# Altium project CubliV2.PrjPcb
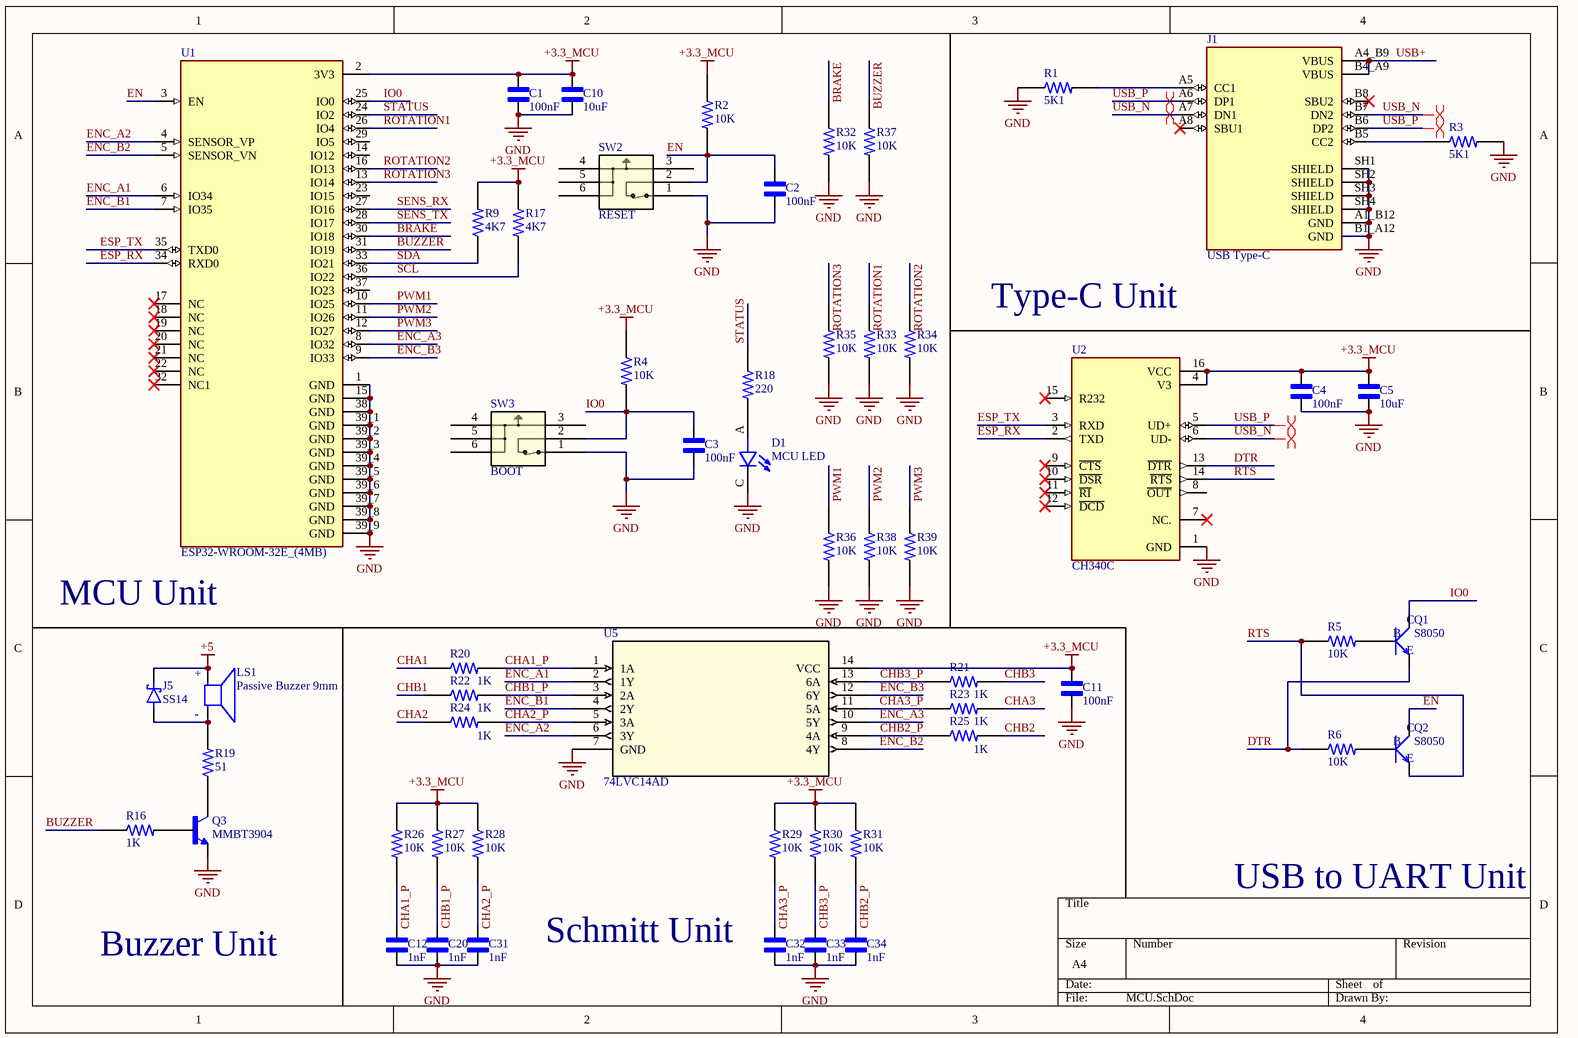
[diagram p0: MCU.SchDoc]
3 sheets, 107 parts. Net scope: global (net labels, ports and power ports of the same name join across sheets).
Board file: CubliV2PCB.PcbDoc
Sheets:
  MCU.SchDoc
  Power.SchDoc
  Connector.SchDoc

## Sheet MCU.SchDoc
size A4; SheetNumber: 1; SheetTotal: 3

### Parts
C1  100nF  [CAPC1608X90N]
C2  100nF  [CAPC1608X90N]
C3  100nF  [CAPC1608X90N]
C4  100nF  [CAPC1608X90N]
C5  10uF  [CAPC1608X90N]
C10  10uF  [CAPC1608X90N]
C11  100nF  [CAPC1608X90N]
C12  1nF  [CAPC1608X90N]
C20  1nF  [CAPC1608X90N]
C31  1nF  [CAPC1608X90N]
C32  1nF  [CAPC1608X90N]
C33  1nF  [CAPC1608X90N]
C34  1nF  [CAPC1608X90N]
D1  MCU LED  [LEDSC125X200X90-2N]
J1  USB Type-C  [AMPHENOL_10155435-00011LF]
J5  SS14  [SMA]
LS1  Passive Buzzer 9mm  [XDCR_AT-0927-TT-2-R]
Q1  S8050  [SOT-23]
Q2  S8050  [SOT-23]
Q3  MMBT3904  [TRANS_MMBT3904]
R1  5K1  [RESC1607X60N]
R2  10K  [RESC1607X60N]
R3  5K1  [RESC1607X60N]
R4  10K  [RESC1607X60N]
R5  10K  [RESC1607X60N]
R6  10K  [RESC1607X60N]
R9  4K7  [RESC1607X60N]
R16  1K  [RESC1607X60N]
R17  4K7  [RESC1607X60N]
R18  220  [RESC1607X60N]
R19  51  [RESC1607X60N]
R20  1K  [RESC1607X60N]
R21  1K  [RESC1607X60N]
R22  1K  [RESC1607X60N]
R23  1K  [RESC1607X60N]
R24  1K  [RESC1607X60N]
R25  1K  [RESC1607X60N]
R26  10K  [RESC1607X60N]
R27  10K  [RESC1607X60N]
R28  10K  [RESC1607X60N]
R29  10K  [RESC1607X60N]
R30  10K  [RESC1607X60N]
R31  10K  [RESC1607X60N]
R32  10K  [RESC1607X60N]
R33  10K  [RESC1607X60N]
R34  10K  [RESC1607X60N]
R35  10K  [RESC1607X60N]
R36  10K  [RESC1607X60N]
R37  10K  [RESC1607X60N]
R38  10K  [RESC1607X60N]
R39  10K  [RESC1607X60N]
SW2  RESET  [PTS820 J25K SMTR LFS_CNK]
SW3  BOOT  [PTS820 J25K SMTR LFS_CNK]
U1  ESP32-WROOM-32E_(4MB)  [XCVR_ESP32-WROOM-32E_(4MB)]
U2  CH340C  [SOIC127P600X180-16N]
U5  74LVC14AD  [SOT108-1_NXP]

### Nets
+3.3_MCU: C1.2 C4.2 C5.2 C10.2 C11.2 R2.1 R4.1 R9.2 R17.1 R26.1 R27.1 R28.1 R29.1 R30.1 R31.1 U1.2(3V3) U2.4(V3) U2.16(VCC) U5.14(VCC)
+5: J5.P2(C) LS1.P
GND: C1.1 C2.1 C3.1 C4.1 C5.1 C10.1 C11.1 C12.2 C20.2 C31.2 C32.2 C33.2 C34.2 D1.C J1.A1_B12(GND) J1.B1_A12(GND) J1.SH1(SHIELD) J1.SH2(SHIELD) J1.SH3(SHIELD) J1.SH4(SHIELD) Q3.2(E) R1.1 R3.2 R32.2 R33.2 R34.2 R35.2 R36.2 R37.2 R38.2 R39.2 SW2.1 SW3.1 U1.1(GND) U1.15(GND) U1.38(GND) U1.39_1(GND) U1.39_2(GND) U1.39_3(GND) U1.39_4(GND) U1.39_5(GND) U1.39_6(GND) U1.39_7(GND) U1.39_8(GND) U1.39_9(GND) U2.1(GND) U5.7(GND)
BRAKE: R32.1 U1.30(IO18)
BUZZER: R16.1 R37.1 U1.31(IO19)
CHA1: R20.1
CHA1_P: C12.1 R20.2 R26.2 U5.1(1A)
CHA2: R24.1
CHA2_P: C31.1 R24.2 R28.2 U5.5(3A)
CHA3: R23.2
CHA3_P: C32.1 R23.1 R29.2 U5.11(5A)
CHB1: R22.1
CHB1_P: C20.1 R22.2 R27.2 U5.3(2A)
CHB2: R25.2
CHB2_P: C34.1 R25.1 R31.2 U5.9(4A)
CHB3: R21.2
CHB3_P: C33.1 R21.1 R30.2 U5.13(6A)
DTR: Q1.2(E) R6.1 U2.13(~{DTR})
EN: C2.2 Q2.3(C) R2.2 SW2.2 U1.3(EN)
ENC_A1: U1.6(IO34) U5.2(1Y)
ENC_A2: U1.4(SENSOR_VP) U5.6(3Y)
ENC_A3: U1.8(IO32) U5.10(5Y)
ENC_B1: U1.7(IO35) U5.4(2Y)
ENC_B2: U1.5(SENSOR_VN) U5.8(4Y)
ENC_B3: U1.9(IO33) U5.12(6Y)
ESP_RX: U1.34(RXD0) U2.2(TXD)
ESP_TX: U1.35(TXD0) U2.3(RXD)
IO0: C3.2 Q1.3(C) R4.2 SW3.2 U1.25(IO0)
PWM1: R36.1 U1.10(IO25)
PWM2: R38.1 U1.11(IO26)
PWM3: R39.1 U1.12(IO27)
ROTATION1: R33.1 U1.26(IO4)
ROTATION2: R34.1 U1.16(IO13)
ROTATION3: R35.1 U1.13(IO14)
RTS: Q2.2(E) R5.1 U2.14(~{RTS})
SCL: R17.2 U1.36(IO22)
SDA: R9.1 U1.33(IO21)
SENS_RX: U1.27(IO16)
SENS_TX: U1.28(IO17)
STATUS: R18.1 U1.24(IO2)
USB+: J1.A4_B9(VBUS) J1.B4_A9(VBUS)
USB_N: J1.A7(DN1) J1.B7(DN2) U2.6(UD-)
USB_P: J1.A6(DP1) J1.B6(DP2) U2.5(UD+)
NetD1_A: D1.A R18.2
NetJ1_A5: J1.A5(CC1) R1.2
NetJ1_B5: J1.B5(CC2) R3.1
NetJ5_P1: J5.P1(A) LS1.N R19.2
NetQ1_1: Q1.1(B) R5.2
NetQ2_1: Q2.1(B) R6.2
NetQ3_1: Q3.1(B) R16.2
NetQ3_3: Q3.3(C) R19.1

Not connected (* = marked no-connect by the designer): J1 A8(SBU1)* B8(SBU2)*; SW2 3 4 5 6; SW3 3 4 5 6; U1 14(IO12) 17(NC)* 18(NC)* 19(NC)* 20(NC)* 21(NC)* 22(NC)* 23(IO15) 29(IO5) 32(NC1)* 37(IO23); U2 7(NC.)* 8(~{OUT}) 9(~{CTS})* 10(~{DSR})* 11(~{RI})* 12(~{DCD})* 15(R232)*

### Layout directives
differential pair: USB_N, USB_P

### Notes on the sheet
- Type-C Unit
- (near U1) MCU Unit
- USB to UART Unit
- Buzzer Unit
- (near C32) Schmitt Unit
- (in symbol AT-0927-TT-2-R) +; -

### Library data of the parts
C1-C5 C10 C11 = GRM188R71H104KA93D: SMD Capacitor X7R(EIA) with Capacitance: 0.10uF Tol. 10%. Rated Voltage: 50Vdc; MF: Murata; SnapEDA_Link: https://www.snapeda.com/parts/GRM188R71H104KA93D/Murata/view-part/?ref=snap; Package: 1608 Murata; Value: *; MP: GRM188R71H104KA93D; Check_prices: https://www.snapeda.com/parts/GRM188R71H104KA93D/Murata/view-part/?ref=eda
C12 C20 C31-C34 = GRM188R71H102KA01D: SMD Capacitor X7R(EIA) with Capacitance: 1000pF Tol. 10%. Rated Voltage: 50Vdc; MF: Murata; SnapEDA_Link: https://www.snapeda.com/parts/GRM188R71H102KA01D/Murata/view-part/?ref=snap; Package: 1608 Murata; Value: *; MP: GRM188R71H102KA01D; Check_prices: https://www.snapeda.com/parts/GRM188R71H102KA01D/Murata/view-part/?ref=eda
D1 = 5990110007F: Red 633nm LED Indication - Discrete 2.1V 0805 (2012 Metric); MF: Dialight; MP: 599-0110-007F; Check_prices: https://www.snapeda.com/parts/599-0110-007F/Dialight/view-part/?ref=eda; Value: *; Purchase-URL: https://pricing.snapeda.com/search/part/599-0110-007F/?ref=eda; Price: None; SnapEDA_Link: https://www.snapeda.com/parts/599-0110-007F/Dialight/view-part/?ref=snap; Availability: In Stock; Package: 0805 Dialight
J1 = 10155435-00011LF: Package: None; Price: None; Value: *; MP: 10155435-00011LF; Availability: Unavailable
J5 = SS14: Diode Schottky 40 V 1A Surface Mount DO-214AC (SMA); MF: onsemi; SnapEDA_Link: https://www.snapeda.com/parts/SS14/Onsemi/view-part/?ref=snap; Package: SMA-2 ON Semiconductor; Value: *; MP: SS14; Check_prices: https://www.snapeda.com/parts/SS14/Onsemi/view-part/?ref=eda
LS1 = AT-0927-TT-2-R: AUDIO TRANSDUCER 3VP-P 70MA 20OHM 86DBA; MF: {'manufacturer': u'PUI Audio, Inc.'}; Package: None; Price: None; Value: *; MP: AT-0927-TT-2-R; Availability: Unavailable
Q1 Q2 = SMD-TRANSISTORS-NPN-25V-500MW(SOT-23): Bipolar (BJT) Transistor NPN 25 V 500 mA 150MHz 300 mW Surface Mount SOT-23; MF: UMW; Purchase-URL: https://pricing.snapeda.com/search/part/S8050/?ref=eda; Check_prices: https://www.snapeda.com/parts/S8050/Umwelt+Sensor+Teknik/view-part/?ref=eda; SnapEDA_Link: https://www.snapeda.com/parts/S8050/Umwelt+Sensor+Teknik/view-part/?ref=snap; Price: None; Availability: In Stock; Package: None; MP: S8050; Value: *
Q3 = MMBT3904: BJT, SOT-23, 40V, 200mA, NPN, 0.35W, 150Â°C; MF: Diotec Semiconductor; SnapEDA_Link: https://www.snapeda.com/parts/MMBT3904/Diotec/view-part/?ref=snap; Package: SOT-23 Diotec; Value: *; MP: MMBT3904; Check_prices: https://www.snapeda.com/parts/MMBT3904/Diotec/view-part/?ref=eda
R1-R6 R9 R16-R39 = RC0603FR-071K2L: 1.2 kOhms Â±1% 0.1W, 1/10W Chip Resistor 0603 (1608 Metric) Moisture Resistant Thick Film; MF: Yageo; SnapEDA_Link: https://www.snapeda.com/parts/RC0603FR-071K2L/Yageo/view-part/?ref=snap; Package: SMD-2 Yageo; Value: *; MP: RC0603FR-071K2L; Check_prices: https://www.snapeda.com/parts/RC0603FR-071K2L/Yageo/view-part/?ref=eda
SW2 SW3 = PTS820 J25K SMTR LFS: Description; Manufacturer_Name: C&K Components; Copyright: Copyright (C) 2026 Ultra Librarian. All rights reserved.; Manufacturer_Part_Number: PTS820 J25K SMTR LFS; RefDes: RefDes; Type: Type
U1 = ESP32-WROOM-32E_(4MB): Bluetooth, WiFi 802.11b/g/n, Bluetooth v4.2 +EDR, Class 1, 2 and 3 Transceiver Module 2.4GHz ~ 2.5GHz Integrated, Trace Surface Mount; MF: Espressif Systems; MP: ESP32-WROOM-32E (4MB); SnapEDA_Link: https://www.snapeda.com/parts/ESP32-WROOM-32E%20(4MB)/Espressif+Systems/view-part/?ref=snap; Package: SMD-44 Espressif Systems; Value: *; Check_prices: https://www.snapeda.com/parts/ESP32-WROOM-32E%20(4MB)/Espressif+Systems/view-part/?ref=eda
U2 = CH340C: USB to serial chip CH340; MF: WCH; Price: None; Availability: Not in stock; MP: CH340C; Package: None; SnapEDA_Link: https://www.snapeda.com/parts/CH340C/WCH/view-part/?ref=snap; Check_prices: https://www.snapeda.com/parts/CH340C/WCH/view-part/?ref=eda; Value: *
U5 = 74LVC14AD: Description; Manufacturer_Name: NXP; Copyright: Copyright (C) 2026 Ultra Librarian. All rights reserved.; Manufacturer_Part_Number: 74LVC14AD; RefDes: RefDes; Type: Type

## Sheet Power.SchDoc
size A4; SheetNumber: 2; SheetTotal: 3
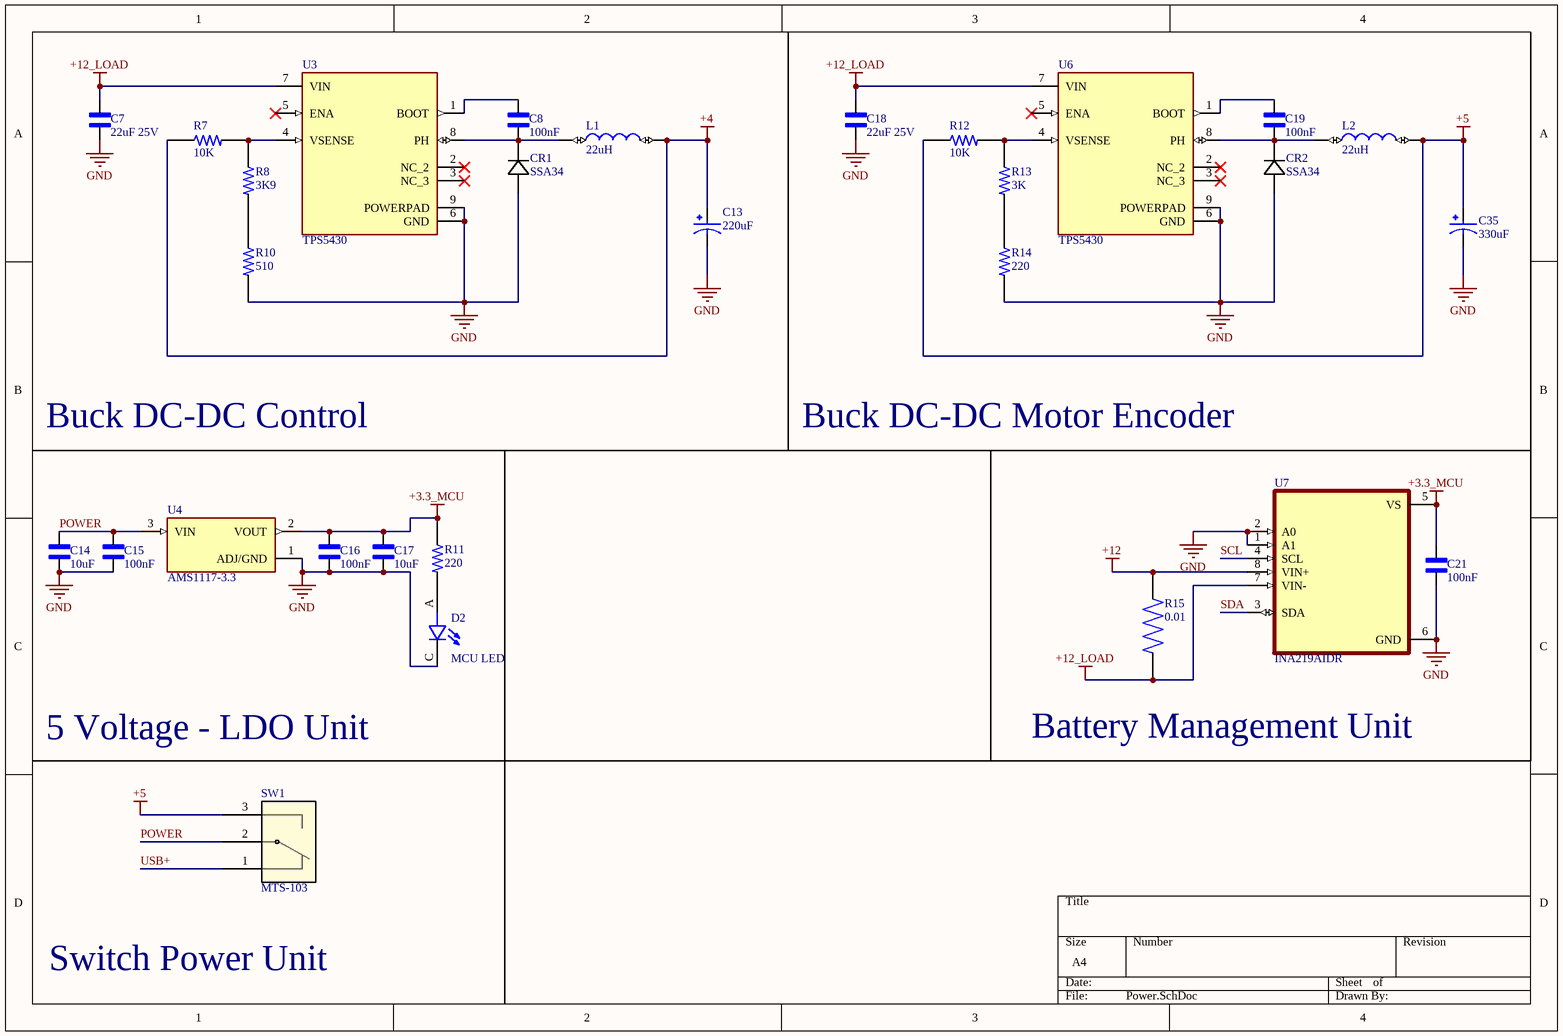
[diagram p1: Power.SchDoc]

### Parts
C7  22uF 25V  [CAPC3216X229N]
C8  100nF  [CAPC1608X90N]
C13  220uF  [CAPPM6032X280N]
C14  10uF  [CAPC3216X110N]
C15  100nF  [CAPC1608X90N]
C16  100nF  [CAPC1608X90N]
C17  10uF  [CAPC3216X110N]
C18  22uF 25V  [CAPC3216X229N]
C19  100nF  [CAPC1608X90N]
C21  100nF  [CAPC1608X90N]
C35  330uF  [CAP_EEEFP1V101AP]
CR1  SSA34  [CR_A34-E35AT_VIS]
CR2  SSA34  [CR_A34-E35AT_VIS]
D2  MCU LED  [LEDSC125X200X90-2N]
L1  22uH  [INDPM120120X800N]
L2  22uH  [INDPM120120X800N]
R7  10K  [RESC1607X60N]
R8  3K9  [RESC1607X60N]
R10  510  [RESC1607X60N]
R11  220  [RESC1607X60N]
R12  10K  [RESC1607X60N]
R13  3K  [RESC1607X60N]
R14  220  [RESC1607X60N]
R15  0.01  [RESC6331X85N]
SW1  MTS-103  [MTS-103_JCV]
U3  TPS5430  [CONV_TPS5430DDAR]
U4  AMS1117-3.3  [SOT229P700X180-4N]
U6  TPS5430  [CONV_TPS5430DDAR]
U7  INA219AIDR  [SOIC127P599X175-8N]

### Nets
+3.3_MCU: C16.2 C17.1 C21.2 R11.1 U4.2(VOUT) U7.5(VS)
+4: C13.1 L1.2 R7.1
+5: C35.1 L2.2 R12.1 SW1.3
+12: R15.2 U7.8(VIN+)
+12_LOAD: C7.2 C18.2 R15.1 U3.7(VIN) U6.7(VIN) U7.7(VIN-)
GND: C7.1 C13.2 C14.2 C15.1 C16.1 C17.2 C18.1 C21.1 C35.2 CR1.2 CR2.2 D2.C R10.2 R14.2 U3.6(GND) U3.9(POWERPAD) U4.1(ADJ/GND) U6.6(GND) U6.9(POWERPAD) U7.1(A1) U7.2(A0) U7.6(GND)
POWER: C14.1 C15.2 SW1.2 U4.3(VIN)
SCL: U7.4(SCL)
SDA: U7.3(SDA)
USB+: SW1.1
NetC8_1: C8.1 CR1.1 L1.1 U3.8(PH)
NetC8_2: C8.2 U3.1(BOOT)
NetC19_1: C19.1 CR2.1 L2.1 U6.8(PH)
NetC19_2: C19.2 U6.1(BOOT)
NetD2_A: D2.A R11.2
NetR7_2: R7.2 R8.1 U3.4(VSENSE)
NetR8_2: R8.2 R10.1
NetR12_2: R12.2 R13.1 U6.4(VSENSE)
NetR13_2: R13.2 R14.1

Not connected (* = marked no-connect by the designer): U3 2(NC_2)* 3(NC_3)* 5(ENA)*; U6 2(NC_2)* 3(NC_3)* 5(ENA)*

### Notes on the sheet
- Buck DC-DC Control
- Buck DC-DC Motor Encoder
- 5 Voltage - LDO Unit
- Battery Management Unit
- Switch Power Unit

### Library data of the parts
C7 C18 = 12063D226KAT2A: MF: {'manufacturer': u'KYOCERA AVX'}; Package: None; Price: None; Value: *; MP: 12063D226KAT2A; Availability: Unavailable
C8 C15 C16 C19 C21 = GRM188R71H104KA93D: as C1 on sheet MCU; SnapEDA_Link: https://www.snapeda.com/parts/GRM188R71H104KA93D/Murata/view-part/?ref=snap; Package: 1608 Murata; Value: *; MP: GRM188R71H104KA93D; Check_prices: https://www.snapeda.com/parts/GRM188R71H104KA93D/Murata/view-part/?ref=eda
C13 = T493C227K006CH6410: 220 ÂµF Molded Tantalum Capacitors 6.3 V 2312 (6032 Metric) 1.2Ohm @ 100kHz; MF: Kemet; SnapEDA_Link: https://www.snapeda.com/parts/T493C227K006CH6410/Kemet/view-part/?ref=snap; Package: SMD-2 Kemet; Value: *; MP: T493C227K006CH6410; Check_prices: https://www.snapeda.com/parts/T493C227K006CH6410/Kemet/view-part/?ref=eda
C14 C17 = T491A106K010AT7280: 10 ÂµF Molded Tantalum Capacitors 10 V 1206 (3216 Metric) 3.8Ohm; MF: KEMET; SnapEDA_Link: https://www.snapeda.com/parts/T491A106K010AT7280/KEMET/view-part/?ref=snap; Package: SMD-2 KEMET; Value: *; MP: T491A106K010AT7280; Check_prices: https://www.snapeda.com/parts/T491A106K010AT7280/KEMET/view-part/?ref=eda
C35 = EEEFP1V101AP: 100ÂµF 35V Aluminum Electrolytic Capacitors Radial, Can - SMD 80mOhm @ 100kHz 2000 Hrs @ 105Â°C; MF: Panasonic Electronic; MP: EEE-FP1V101AP; SnapEDA_Link: https://www.snapeda.com/parts/EEE-FP1V101AP/Panasonic/view-part/?ref=snap; Package: RADIAL-2 Panasonic; Value: *; Check_prices: https://www.snapeda.com/parts/EEE-FP1V101AP/Panasonic/view-part/?ref=eda
CR1 CR2 = SSA34-E35AT: 3A,40V,SMA SKY RECT; Manufacturer_Name: Vishay; Manufacturer_Part_Number: SSA34-E3/5AT; Copyright: Copyright (C) 2026 Ultra Librarian. All rights reserved.
D2 = 5990110007F: as D1 on sheet MCU; Check_prices: https://www.snapeda.com/parts/599-0110-007F/Dialight/view-part/?ref=eda; Value: *; Purchase-URL: https://pricing.snapeda.com/search/part/599-0110-007F/?ref=eda; Price: None; SnapEDA_Link: https://www.snapeda.com/parts/599-0110-007F/Dialight/view-part/?ref=snap; Availability: In Stock; Package: 0805 Dialight
L1 L2 = CDRH127_LDNP-221MC: 220 ÂµH Shielded - Inductor 1.45 A 338mOhm Max Nonstandard; MF: Sumida America; MP: CDRH127/LDNP-221MC; SnapEDA_Link: https://www.snapeda.com/parts/CDRH127/LDNP-221MC/Sumida+America+Components+Inc./view-part/?ref=snap; Package: Nonstandard Sumida; Value: *; Check_prices: https://www.snapeda.com/parts/CDRH127/LDNP-221MC/Sumida+America+Components+Inc./view-part/?ref=eda
R7 R8 R10-R14 = RC0603FR-071K2L: as R1 on sheet MCU; SnapEDA_Link: https://www.snapeda.com/parts/RC0603FR-071K2L/Yageo/view-part/?ref=snap; Package: SMD-2 Yageo; Value: *; MP: RC0603FR-071K2L; Check_prices: https://www.snapeda.com/parts/RC0603FR-071K2L/Yageo/view-part/?ref=eda
R15 = CSNL2512FT1L00: 1 mOhms Â±1% 2W Chip Resistor 2512 (6432 Metric) Current Sense, Moisture Resistant Metal Element; MF: Stackpole Electronics Inc; SnapEDA_Link: https://www.snapeda.com/parts/CSNL2512FT1L00/Stackpole+Electronics/view-part/?ref=snap; Package: 6331 Stackpole; Value: *; MP: CSNL2512FT1L00; Check_prices: https://www.snapeda.com/parts/CSNL2512FT1L00/Stackpole+Electronics/view-part/?ref=eda
SW1 = MTS-103: Description; Manufacturer_Name: Jameco Valuepro; Type: Toggle Switches; Copyright: Copyright (C) 2026 Ultra Librarian. All rights reserved.; Manufacturer_Part_Number: MTS-103; RefDes: RefDes
U3 U6 = TPS5430DDAR: 5.5V to 36V Input, 3A, 500kHz Step-Down Converter; MF: Texas Instruments; Package: HSOIC-8 Texas Instruments; Check_prices: https://www.snapeda.com/parts/TPS5430DDAR/Texas+Instruments/view-part/?ref=eda; Value: *; Purchase-URL: https://pricing.snapeda.com/search/part/TPS5430DDAR/?ref=eda; Availability: In Stock; SnapEDA_Link: https://www.snapeda.com/parts/TPS5430DDAR/Texas+Instruments/view-part/?ref=snap; MP: TPS5430DDAR; Price: None
U4 = AMS1117-3.3: Linear Voltage Regulator IC Positive Fixed 1 Output 1A SOT-223-3L; MF: UMW; SnapEDA_Link: https://www.snapeda.com/parts/AMS1117-3.3/UMW/view-part/?ref=snap; Package: SOT-223-3L UMW; Value: *; MP: AMS1117-3.3; Check_prices: https://www.snapeda.com/parts/AMS1117-3.3/UMW/view-part/?ref=eda
U7 = INA219AIDR: 26-V 12-bit I2C output digital power monitor; MF: Texas Instruments; SnapEDA_Link: https://www.snapeda.com/parts/INA219AIDR/Texas+Instruments/view-part/?ref=snap; Package: SOIC-8 Texas Instruments; Value: *; MP: INA219AIDR; Check_prices: https://www.snapeda.com/parts/INA219AIDR/Texas+Instruments/view-part/?ref=eda

## Sheet Connector.SchDoc
size A4; SheetNumber: 3; SheetTotal: 3
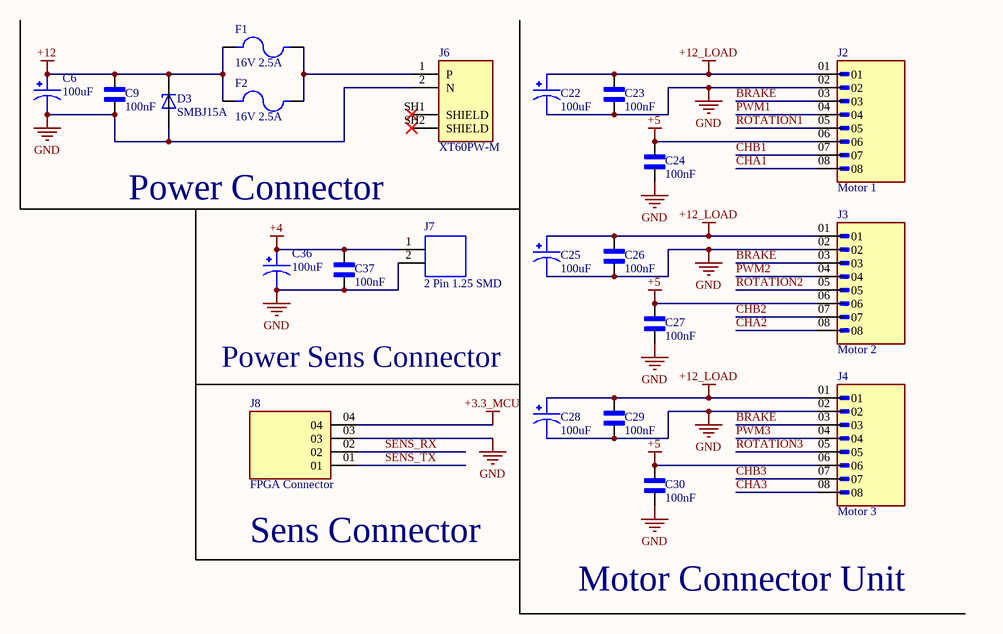
[diagram p2: Connector.SchDoc]

### Parts
C6  100uF  [CAPAE830X1000N]
C9  100nF  [CAPC1608X90N]
C22  100uF  [CAPAE830X1000N]
C23  100nF  [CAPC1608X90N]
C24  100nF  [CAPC1608X90N]
C25  100uF  [CAPAE830X1000N]
C26  100nF  [CAPC1608X90N]
C27  100nF  [CAPC1608X90N]
C28  100uF  [CAPAE830X1000N]
C29  100nF  [CAPC1608X90N]
C30  100nF  [CAPC1608X90N]
C36  100uF  [CAPAE830X1000N]
C37  100nF  [CAPC1608X90N]
D3  SMBJ15A  [DIOM4336X265N]
F1  16V 2.5A  [FUSER_MF-MSMF250/16X-2]
F2  16V 2.5A  [FUSER_MF-MSMF250/16X-2]
J2  Motor 1  [PHOENIX_1803484]
J3  Motor 2  [PHOENIX_1803484]
J4  Motor 3  [PHOENIX_1803484]
J6  XT60PW-M  [AMASS_XT60PW-M]
J7  2 Pin 1.25 SMD  [CONN_532610001-SD_02_MOL]
J8  FPGA Connector  [SAMTEC_TSW-104-07-T-S-LL]

### Nets
+3.3_MCU: J8.04
+4: C36.1 C37.2 J7.1
+5: C24.2 C27.2 C30.2 J2.06 J3.06 J4.06
+12: C6.1 C9.2 D3.C F1.1 F2.1
+12_LOAD: C22.1 C23.2 C25.1 C26.2 C28.1 C29.2 J2.01 J3.01 J4.01
GND: C6.2 C9.1 C22.2 C23.1 C24.1 C25.2 C26.1 C27.1 C28.2 C29.1 C30.1 C36.2 C37.1 D3.A J2.02 J3.02 J4.02 J6.2(N) J7.2 J8.03
BRAKE: J2.03 J3.03 J4.03
CHA1: J2.08
CHA2: J3.08
CHA3: J4.08
CHB1: J2.07
CHB2: J3.07
CHB3: J4.07
PWM1: J2.04
PWM2: J3.04
PWM3: J4.04
ROTATION1: J2.05
ROTATION2: J3.05
ROTATION3: J4.05
SENS_RX: J8.02
SENS_TX: J8.01
NetF1_2: F1.2 F2.2 J6.1(P)

Not connected (* = marked no-connect by the designer): J6 SH1(SHIELD)* SH2(SHIELD)*

### Notes on the sheet
- Power Connector
- Power Sens Connector
- (near J8) Sens Connector
- Motor Connector Unit

### Library data of the parts
C6 C22 C25 C28 C36 = UWT1V101MCL1GS: Capacitor Aluminum Electrolytic, 1000h 6.3 (Dia.) x 7.7mm, 100uF, 35V, WT Series | Nichicon UWT1V101MCL1GS; SnapEDA_Link: https://www.snapeda.com/parts/UWT1V101MCL1GS/Nichicon/view-part/?ref=snap; Package: Radial Nichicon; Value: *; MF: Nichicon; MP: UWT1V101MCL1GS; Check_prices: https://www.snapeda.com/parts/UWT1V101MCL1GS/Nichicon/view-part/?ref=eda
C9 C23 C24 C26 C27 C29 C30 C37 = GRM188R71H104KA93D: as C1 on sheet MCU; SnapEDA_Link: https://www.snapeda.com/parts/GRM188R71H104KA93D/Murata/view-part/?ref=snap; Package: 1608 Murata; Value: *; MP: GRM188R71H104KA93D; Check_prices: https://www.snapeda.com/parts/GRM188R71H104KA93D/Murata/view-part/?ref=eda
D3 = SMBJ15A: 600W, 17.6V, 5%, Unidirectional, TVS; MF: Taiwan Semiconductor; SnapEDA_Link: https://www.snapeda.com/parts/SMBJ15A/taiwan/view-part/?ref=snap; Package: SMD-2 Taiwan Semiconductor; Value: *; MP: SMBJ15A; Check_prices: https://www.snapeda.com/parts/SMBJ15A/taiwan/view-part/?ref=eda
F1 F2 = MF-MSMF250/16X-2: Polymeric PTC Resettable Fuse 16V 2.5 A Ih Surface Mount 1812 (4532 Metric), Concave; MF: Bourns; Availability: In Stock; SnapEDA_Link: https://www.snapeda.com/parts/MF-MSMF250/16X-2/Bourns/view-part/?ref=snap; Price: None; Check_prices: https://www.snapeda.com/parts/MF-MSMF250/16X-2/Bourns/view-part/?ref=eda; Package: 1812 Bourns; MP: MF-MSMF250/16X-2; Purchase-URL: https://pricing.snapeda.com/search/part/MF-MSMF250/16X-2/?ref=eda; Value: *
J2-J4 = 1803484: MF: {'manufacturer': u'Phoenix Contact'}; Package: None; Price: None; Value: *; MP: 1803484; Availability: Unavailable
J6 = XT60PW-M: Socket, DC supply, male, PIN: 2; MF: AMASS; SnapEDA_Link: https://www.snapeda.com/parts/XT60PW-M/AMASS/view-part/?ref=snap; Package: Package; Value: *; MP: XT60PW-M; Check_prices: https://www.snapeda.com/parts/XT60PW-M/AMASS/view-part/?ref=eda
J7 = 532610271: Connector Header Surface Mount, Right Angle 2 position 0.049 (1.25mm); MF: Molex; SnapEDA_Link: https://www.snapeda.com/parts/532610271/Molex/view-part/?ref=snap; Package: None; Value: *; MP: 532610271; Check_prices: https://www.snapeda.com/parts/532610271/Molex/view-part/?ref=eda
J8 = TSW-104-07-T-S-LL: Availability: Unavailable; Price: None; MP: TSW-104-07-T-S-LL; Package: None; Value: *

## Nets that join several sheets
+3.3_MCU: MCU (19 pins), Power (6 pins), Connector (J8.04)
+4: Power (C13.1 L1.2 R7.1), Connector (C36.1 C37.2 J7.1)
+5: MCU (J5.P2 LS1.P), Power (C35.1 L2.2 R12.1 SW1.3), Connector (6 pins)
+12: Power (R15.2 U7.8), Connector (5 pins)
+12_LOAD: Power (6 pins), Connector (9 pins)
GND: MCU (47 pins), Power (22 pins), Connector (20 pins)
BRAKE: MCU (R32.1 U1.30), Connector (J2.03 J3.03 J4.03)
CHA1: MCU (R20.1), Connector (J2.08)
CHA2: MCU (R24.1), Connector (J3.08)
CHA3: MCU (R23.2), Connector (J4.08)
CHB1: MCU (R22.1), Connector (J2.07)
CHB2: MCU (R25.2), Connector (J3.07)
CHB3: MCU (R21.2), Connector (J4.07)
PWM1: MCU (R36.1 U1.10), Connector (J2.04)
PWM2: MCU (R38.1 U1.11), Connector (J3.04)
PWM3: MCU (R39.1 U1.12), Connector (J4.04)
ROTATION1: MCU (R33.1 U1.26), Connector (J2.05)
ROTATION2: MCU (R34.1 U1.16), Connector (J3.05)
ROTATION3: MCU (R35.1 U1.13), Connector (J4.05)
SCL: MCU (R17.2 U1.36), Power (U7.4)
SDA: MCU (R9.1 U1.33), Power (U7.3)
SENS_RX: MCU (U1.27), Connector (J8.02)
SENS_TX: MCU (U1.28), Connector (J8.01)
USB+: MCU (J1.A4_B9 J1.B4_A9), Power (SW1.1)